# Altium schematic sheet noise_source.schdoc
size 400 x 277 mm; Device: default420x297; Symbol: default420x297; Name: default420x297; Size: "User"; Id: /; File: noise_source; Sheet: /
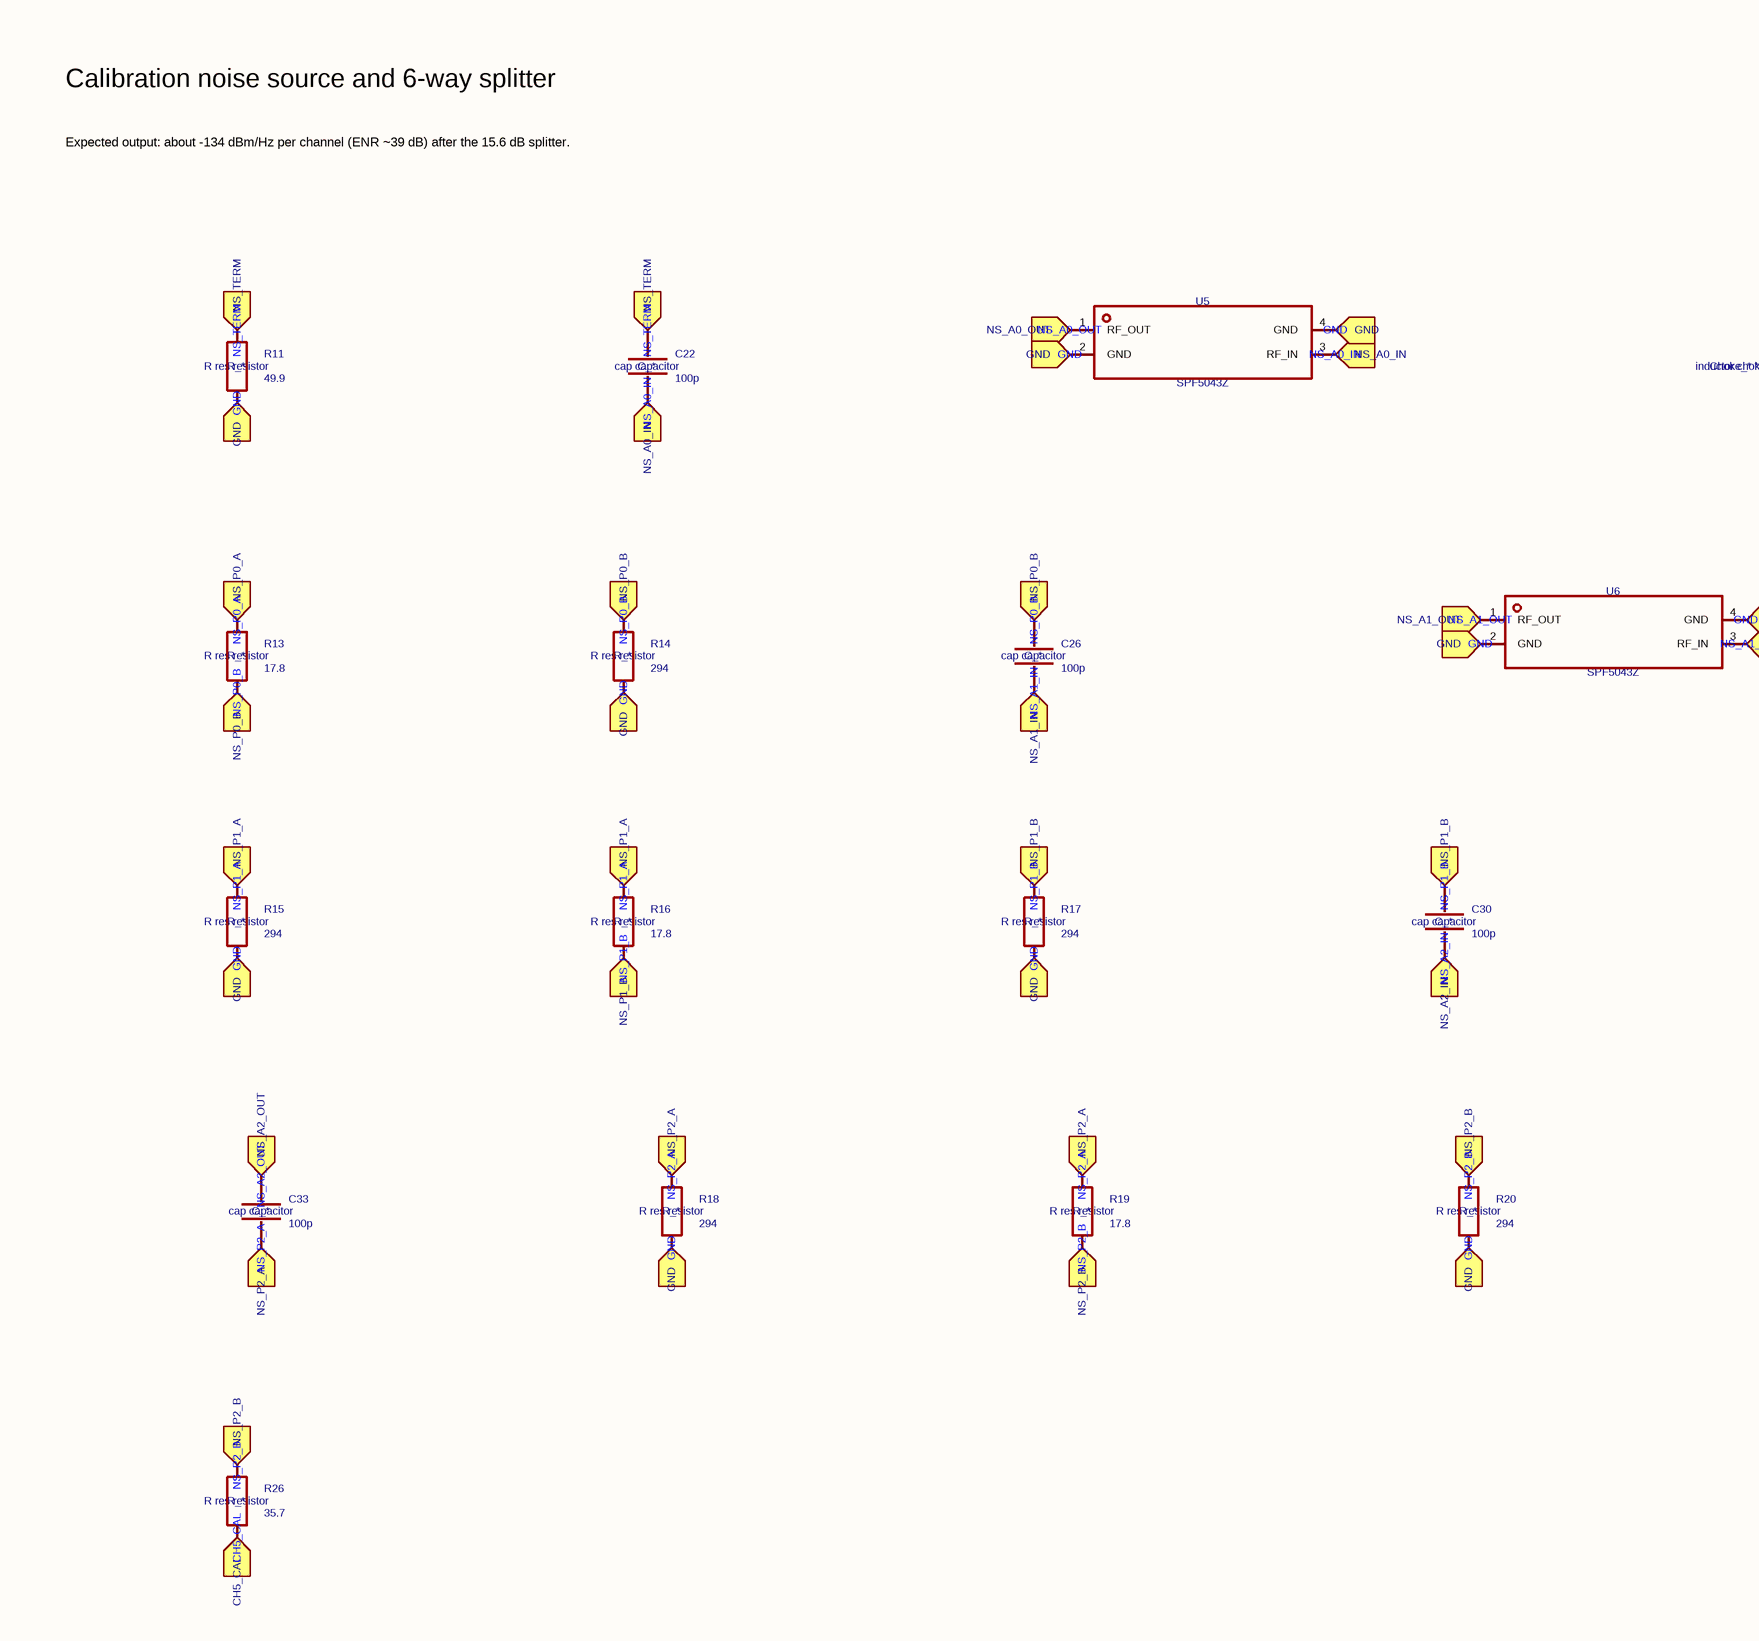
[diagram p0: noise_source.schdoc, left]
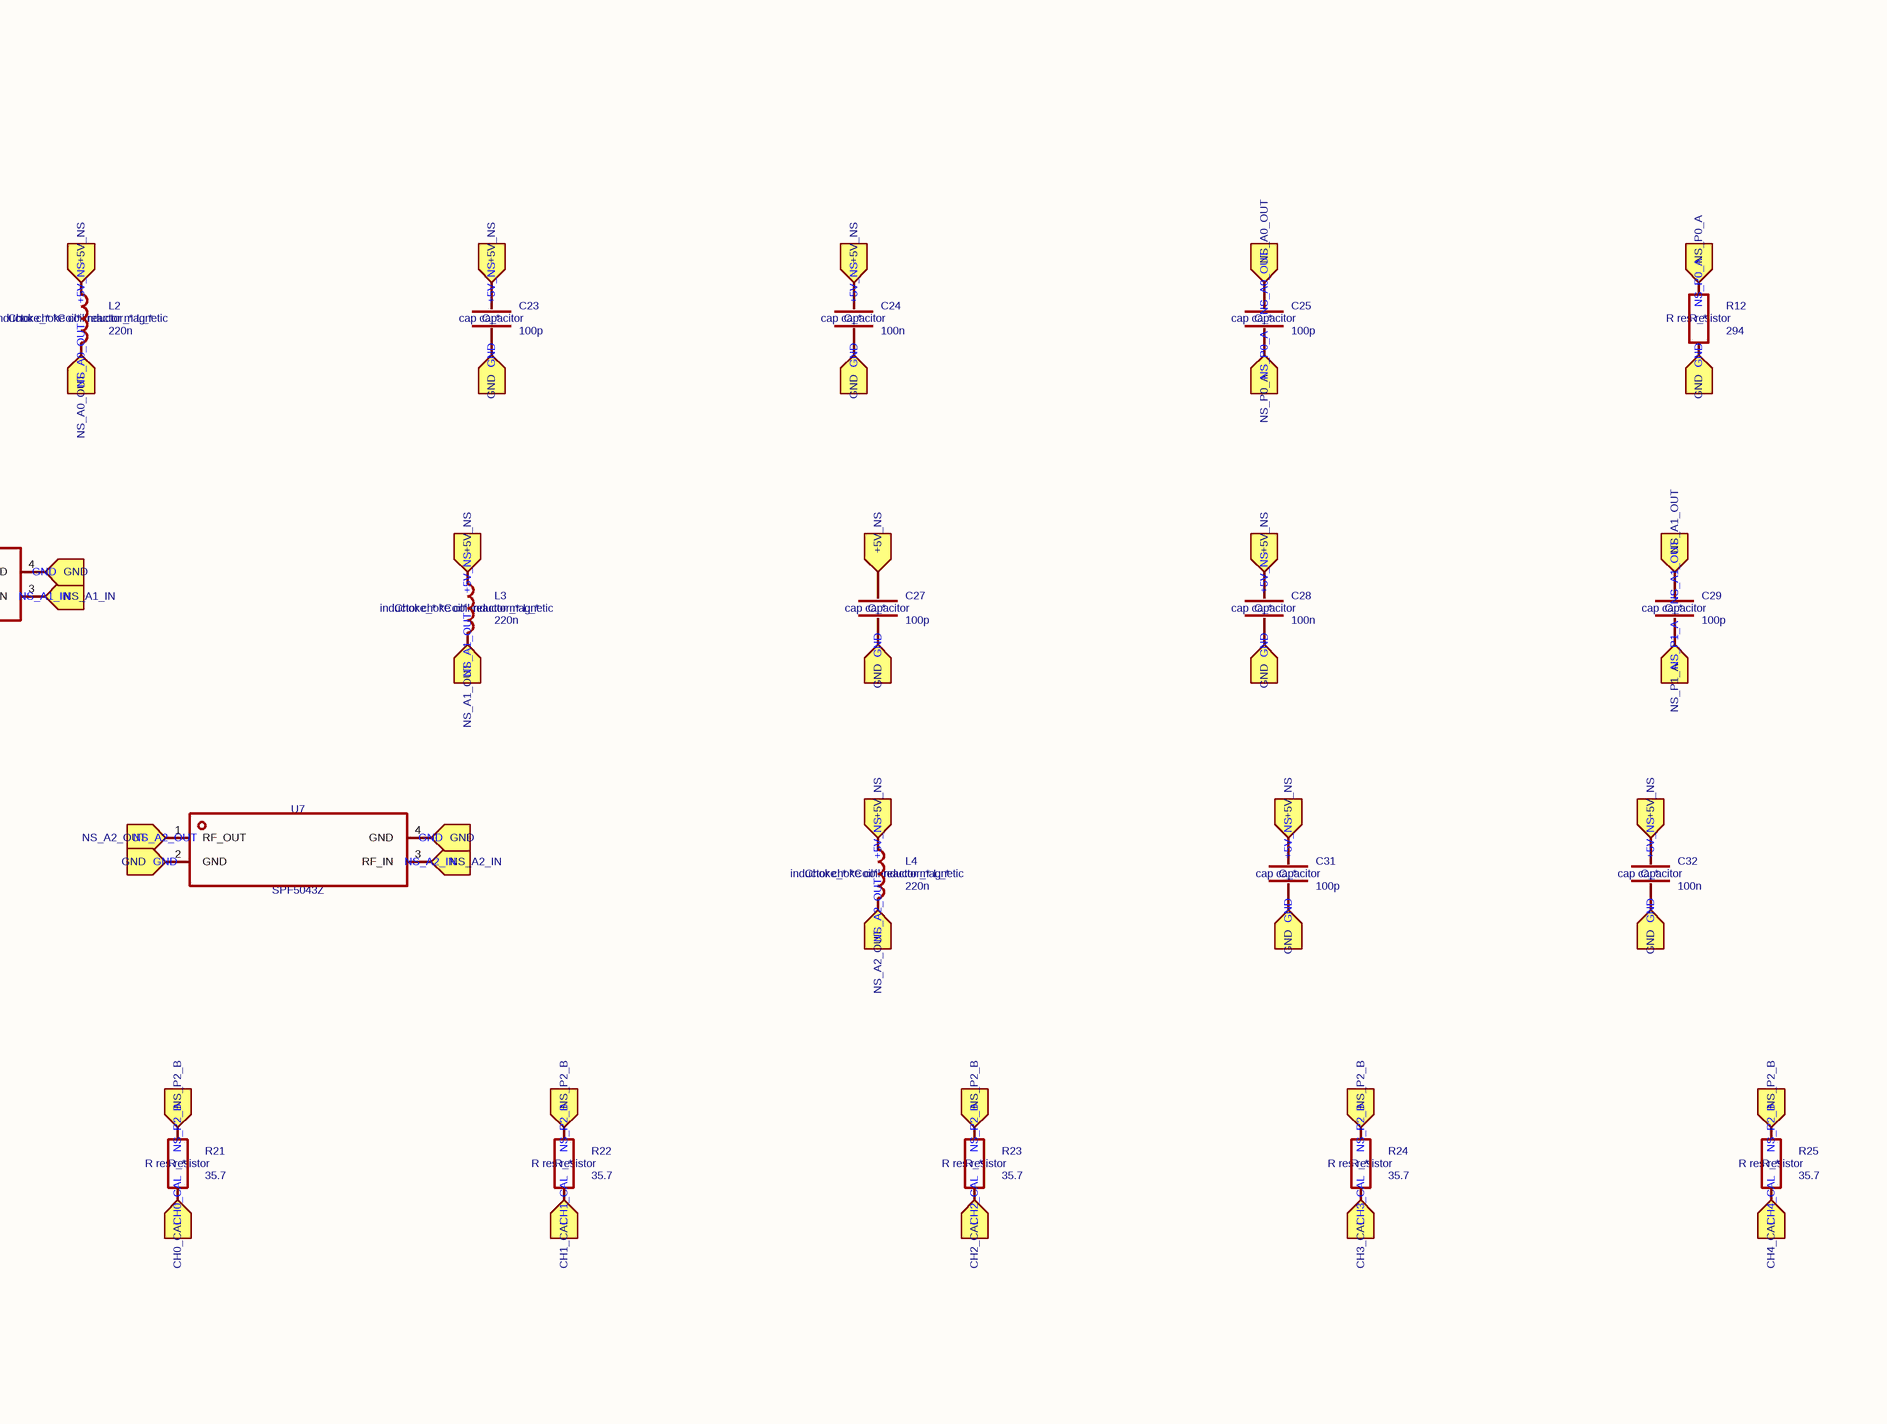
[diagram p1: noise_source.schdoc, right]

## Parts
C22  value 100p  ki_keywords: cap capacitor  ki_fp_filters: C_*  [Capacitor_SMD:C_0402_1005Metric]  (hidden comment: Device_C)
C23  value 100p  ki_keywords: cap capacitor  ki_fp_filters: C_*  [Capacitor_SMD:C_0402_1005Metric]  (hidden comment: Device_C)
C24  value 100n  ki_keywords: cap capacitor  ki_fp_filters: C_*  [Capacitor_SMD:C_0402_1005Metric]  (hidden comment: Device_C)
C25  value 100p  ki_keywords: cap capacitor  ki_fp_filters: C_*  [Capacitor_SMD:C_0402_1005Metric]  (hidden comment: Device_C)
C26  value 100p  ki_keywords: cap capacitor  ki_fp_filters: C_*  [Capacitor_SMD:C_0402_1005Metric]  (hidden comment: Device_C)
C27  value 100p  ki_keywords: cap capacitor  ki_fp_filters: C_*  [Capacitor_SMD:C_0402_1005Metric]  (hidden comment: Device_C)
C28  value 100n  ki_keywords: cap capacitor  ki_fp_filters: C_*  [Capacitor_SMD:C_0402_1005Metric]  (hidden comment: Device_C)
C29  value 100p  ki_keywords: cap capacitor  ki_fp_filters: C_*  [Capacitor_SMD:C_0402_1005Metric]  (hidden comment: Device_C)
C30  value 100p  ki_keywords: cap capacitor  ki_fp_filters: C_*  [Capacitor_SMD:C_0402_1005Metric]  (hidden comment: Device_C)
C31  value 100p  ki_keywords: cap capacitor  ki_fp_filters: C_*  [Capacitor_SMD:C_0402_1005Metric]  (hidden comment: Device_C)
C32  value 100n  ki_keywords: cap capacitor  ki_fp_filters: C_*  [Capacitor_SMD:C_0402_1005Metric]  (hidden comment: Device_C)
C33  value 100p  ki_keywords: cap capacitor  ki_fp_filters: C_*  [Capacitor_SMD:C_0402_1005Metric]  (hidden comment: Device_C)
L2  value 220n  ki_keywords: inductor choke coil reactor magnetic  ki_fp_filters: Choke_* *Coil* Inductor_* L_*  [Inductor_SMD:L_0603_1608Metric]  (hidden comment: Device_L)
L3  value 220n  ki_keywords: inductor choke coil reactor magnetic  ki_fp_filters: Choke_* *Coil* Inductor_* L_*  [Inductor_SMD:L_0603_1608Metric]  (hidden comment: Device_L)
L4  value 220n  ki_keywords: inductor choke coil reactor magnetic  ki_fp_filters: Choke_* *Coil* Inductor_* L_*  [Inductor_SMD:L_0603_1608Metric]  (hidden comment: Device_L)
R11  value 49.9  ki_keywords: R res resistor  ki_fp_filters: R_*  [Resistor_SMD:R_0402_1005Metric]  (hidden comment: Device_R)
R12  value 294  ki_keywords: R res resistor  ki_fp_filters: R_*  [Resistor_SMD:R_0402_1005Metric]  (hidden comment: Device_R)
R13  value 17.8  ki_keywords: R res resistor  ki_fp_filters: R_*  [Resistor_SMD:R_0402_1005Metric]  (hidden comment: Device_R)
R14  value 294  ki_keywords: R res resistor  ki_fp_filters: R_*  [Resistor_SMD:R_0402_1005Metric]  (hidden comment: Device_R)
R15  value 294  ki_keywords: R res resistor  ki_fp_filters: R_*  [Resistor_SMD:R_0402_1005Metric]  (hidden comment: Device_R)
R16  value 17.8  ki_keywords: R res resistor  ki_fp_filters: R_*  [Resistor_SMD:R_0402_1005Metric]  (hidden comment: Device_R)
R17  value 294  ki_keywords: R res resistor  ki_fp_filters: R_*  [Resistor_SMD:R_0402_1005Metric]  (hidden comment: Device_R)
R18  value 294  ki_keywords: R res resistor  ki_fp_filters: R_*  [Resistor_SMD:R_0402_1005Metric]  (hidden comment: Device_R)
R19  value 17.8  ki_keywords: R res resistor  ki_fp_filters: R_*  [Resistor_SMD:R_0402_1005Metric]  (hidden comment: Device_R)
R20  value 294  ki_keywords: R res resistor  ki_fp_filters: R_*  [Resistor_SMD:R_0402_1005Metric]  (hidden comment: Device_R)
R21  value 35.7  ki_keywords: R res resistor  ki_fp_filters: R_*  [Resistor_SMD:R_0402_1005Metric]  (hidden comment: Device_R)
R22  value 35.7  ki_keywords: R res resistor  ki_fp_filters: R_*  [Resistor_SMD:R_0402_1005Metric]  (hidden comment: Device_R)
R23  value 35.7  ki_keywords: R res resistor  ki_fp_filters: R_*  [Resistor_SMD:R_0402_1005Metric]  (hidden comment: Device_R)
R24  value 35.7  ki_keywords: R res resistor  ki_fp_filters: R_*  [Resistor_SMD:R_0402_1005Metric]  (hidden comment: Device_R)
R25  value 35.7  ki_keywords: R res resistor  ki_fp_filters: R_*  [Resistor_SMD:R_0402_1005Metric]  (hidden comment: Device_R)
R26  value 35.7  ki_keywords: R res resistor  ki_fp_filters: R_*  [Resistor_SMD:R_0402_1005Metric]  (hidden comment: Device_R)
U5  value SPF5043Z  [prc:SOT343_L2.0-W1.3-P1.30-LS2.1-BL]  (hidden comment: prc_SPF5043Z)
U6  value SPF5043Z  [prc:SOT343_L2.0-W1.3-P1.30-LS2.1-BL]  (hidden comment: prc_SPF5043Z)
U7  value SPF5043Z  [prc:SOT343_L2.0-W1.3-P1.30-LS2.1-BL]  (hidden comment: prc_SPF5043Z)

## Ports
+5V_NS (in), CH0_CAL (in), CH1_CAL (in), CH2_CAL (in), CH3_CAL (in), CH4_CAL (in), CH5_CAL (in), GND (in), NS_A0_IN (in), NS_A0_OUT (in), NS_A1_IN (in), NS_A1_OUT (in), NS_A2_IN (in), NS_A2_OUT (in), NS_P0_A (in), NS_P0_B (in), NS_P1_A (in), NS_P1_B (in), NS_P2_A (in), NS_P2_B (in), NS_TERM (in)

## Nets
+5V_NS: C23.1 C24.1 C27.1 C28.1 C31.1 C32.1 L2.1 L3.1 L4.1 ; port +5V_NS
CH0_CAL: R21.2 ; port CH0_CAL
CH1_CAL: R22.2 ; port CH1_CAL
CH2_CAL: R23.2 ; port CH2_CAL
CH3_CAL: R24.2 ; port CH3_CAL
CH4_CAL: R25.2 ; port CH4_CAL
CH5_CAL: R26.2 ; port CH5_CAL
GND: C23.2 C24.2 C27.2 C28.2 C31.2 C32.2 R11.2 R12.2 R14.2 R15.2 R17.2 R18.2 R20.2 U5.2(GND) U5.4(GND) U6.2(GND) U6.4(GND) U7.2(GND) U7.4(GND) ; port GND
NS_A0_IN: C22.2 U5.3(RF_IN) ; port NS_A0_IN
NS_A0_OUT: C25.1 L2.2 U5.1(RF_OUT) ; port NS_A0_OUT
NS_A1_IN: C26.2 U6.3(RF_IN) ; port NS_A1_IN
NS_A1_OUT: C29.1 L3.2 U6.1(RF_OUT) ; port NS_A1_OUT
NS_A2_IN: C30.2 U7.3(RF_IN) ; port NS_A2_IN
NS_A2_OUT: C33.1 L4.2 U7.1(RF_OUT) ; port NS_A2_OUT
NS_P0_A: C25.2 R12.1 R13.1 ; port NS_P0_A
NS_P0_B: C26.1 R13.2 R14.1 ; port NS_P0_B
NS_P1_A: C29.2 R15.1 R16.1 ; port NS_P1_A
NS_P1_B: C30.1 R16.2 R17.1 ; port NS_P1_B
NS_P2_A: C33.2 R18.1 R19.1 ; port NS_P2_A
NS_P2_B: R19.2 R20.1 R21.1 R22.1 R23.1 R24.1 R25.1 R26.1 ; port NS_P2_B
NS_TERM: C22.1 R11.1 ; port NS_TERM

## Notes on the sheet
- Calibration noise source and 6-way splitter
- Expected output: about -134 dBm/Hz per channel (ENR ~39 dB) after the 15.6 dB splitter.
- 1
- 2
- 3
- 4
- 5
- 6
- 7
- 8
- A
- B
- C
- D
- E
- Size:"User"
- Title:
- File:noise_source
- Sheet:/
- Date:
- Rev:
- F
- Id:/

## Library data of the parts
C22 = Device_C: UniqueId: 7f35450ac3171d20; KiLib_Generator: SMD_2terminal_chip_molded; AddInBom: yes; Device: Device_C; Symbol: Device_C; FootprintName: Capacitor_SMD:C_0402_1005Metric
C23 = Device_C: UniqueId: 8bc5c1e1749a19fa; KiLib_Generator: SMD_2terminal_chip_molded; AddInBom: yes; Device: Device_C; Symbol: Device_C; FootprintName: Capacitor_SMD:C_0402_1005Metric
C24 = Device_C: UniqueId: 7c674fedd66d7165; KiLib_Generator: SMD_2terminal_chip_molded; AddInBom: yes; Device: Device_C; Symbol: Device_C; LCSC: C1525; FootprintName: Capacitor_SMD:C_0402_1005Metric
C25 = Device_C: UniqueId: d99985aa138ce050; KiLib_Generator: SMD_2terminal_chip_molded; AddInBom: yes; Device: Device_C; Symbol: Device_C; FootprintName: Capacitor_SMD:C_0402_1005Metric
C26 = Device_C: UniqueId: 5bc8fc857418e778; KiLib_Generator: SMD_2terminal_chip_molded; AddInBom: yes; Device: Device_C; Symbol: Device_C; FootprintName: Capacitor_SMD:C_0402_1005Metric
C27 = Device_C: UniqueId: a26eb100929f0697; KiLib_Generator: SMD_2terminal_chip_molded; AddInBom: yes; Device: Device_C; Symbol: Device_C; FootprintName: Capacitor_SMD:C_0402_1005Metric
C28 = Device_C: UniqueId: e3aeb17489c0ab5d; KiLib_Generator: SMD_2terminal_chip_molded; AddInBom: yes; Device: Device_C; Symbol: Device_C; LCSC: C1525; FootprintName: Capacitor_SMD:C_0402_1005Metric
C29 = Device_C: UniqueId: 5bfcee5f0e3d202c; KiLib_Generator: SMD_2terminal_chip_molded; AddInBom: yes; Device: Device_C; Symbol: Device_C; FootprintName: Capacitor_SMD:C_0402_1005Metric
C30 = Device_C: UniqueId: a2ee6ceb65d30336; KiLib_Generator: SMD_2terminal_chip_molded; AddInBom: yes; Device: Device_C; Symbol: Device_C; FootprintName: Capacitor_SMD:C_0402_1005Metric
C31 = Device_C: UniqueId: cc1d00c51cc12124; KiLib_Generator: SMD_2terminal_chip_molded; AddInBom: yes; Device: Device_C; Symbol: Device_C; FootprintName: Capacitor_SMD:C_0402_1005Metric
C32 = Device_C: UniqueId: d2625f4b4bd439ef; KiLib_Generator: SMD_2terminal_chip_molded; AddInBom: yes; Device: Device_C; Symbol: Device_C; LCSC: C1525; FootprintName: Capacitor_SMD:C_0402_1005Metric
C33 = Device_C: UniqueId: deb55bbe20a101cf; KiLib_Generator: SMD_2terminal_chip_molded; AddInBom: yes; Device: Device_C; Symbol: Device_C; FootprintName: Capacitor_SMD:C_0402_1005Metric
L2 = Device_L: UniqueId: 3f6ee2b1a34b017f; KiLib_Generator: SMD_2terminal_chip_molded; AddInBom: yes; Device: Device_L; Symbol: Device_L; FootprintName: Inductor_SMD:L_0603_1608Metric
L3 = Device_L: UniqueId: 510f7e7047da8839; KiLib_Generator: SMD_2terminal_chip_molded; AddInBom: yes; Device: Device_L; Symbol: Device_L; FootprintName: Inductor_SMD:L_0603_1608Metric
L4 = Device_L: UniqueId: fd5a5c0f77d1aabb; KiLib_Generator: SMD_2terminal_chip_molded; AddInBom: yes; Device: Device_L; Symbol: Device_L; FootprintName: Inductor_SMD:L_0603_1608Metric
R11 = Device_R: UniqueId: 763cf8d5648cb4fd; KiLib_Generator: SMD_2terminal_chip_molded; AddInBom: yes; Device: Device_R; Symbol: Device_R; FootprintName: Resistor_SMD:R_0402_1005Metric
R12 = Device_R: UniqueId: 15ac9218146e0f4b; KiLib_Generator: SMD_2terminal_chip_molded; AddInBom: yes; Device: Device_R; Symbol: Device_R; FootprintName: Resistor_SMD:R_0402_1005Metric
R13 = Device_R: UniqueId: ff4077a9ca69db92; KiLib_Generator: SMD_2terminal_chip_molded; AddInBom: yes; Device: Device_R; Symbol: Device_R; FootprintName: Resistor_SMD:R_0402_1005Metric
R14 = Device_R: UniqueId: 8b54177fc4d64d35; KiLib_Generator: SMD_2terminal_chip_molded; AddInBom: yes; Device: Device_R; Symbol: Device_R; FootprintName: Resistor_SMD:R_0402_1005Metric
R15 = Device_R: UniqueId: feece054417b9159; KiLib_Generator: SMD_2terminal_chip_molded; AddInBom: yes; Device: Device_R; Symbol: Device_R; FootprintName: Resistor_SMD:R_0402_1005Metric
R16 = Device_R: UniqueId: 3c543c7c58e1cc80; KiLib_Generator: SMD_2terminal_chip_molded; AddInBom: yes; Device: Device_R; Symbol: Device_R; FootprintName: Resistor_SMD:R_0402_1005Metric
R17 = Device_R: UniqueId: 6346d187b4e0bc9c; KiLib_Generator: SMD_2terminal_chip_molded; AddInBom: yes; Device: Device_R; Symbol: Device_R; FootprintName: Resistor_SMD:R_0402_1005Metric
R18 = Device_R: UniqueId: 5f673669f0d56d8f; KiLib_Generator: SMD_2terminal_chip_molded; AddInBom: yes; Device: Device_R; Symbol: Device_R; FootprintName: Resistor_SMD:R_0402_1005Metric
R19 = Device_R: UniqueId: a32210a39874d8f8; KiLib_Generator: SMD_2terminal_chip_molded; AddInBom: yes; Device: Device_R; Symbol: Device_R; FootprintName: Resistor_SMD:R_0402_1005Metric
R20 = Device_R: UniqueId: 13e77c54ede4b306; KiLib_Generator: SMD_2terminal_chip_molded; AddInBom: yes; Device: Device_R; Symbol: Device_R; FootprintName: Resistor_SMD:R_0402_1005Metric
R21 = Device_R: UniqueId: c77b08197b178948; KiLib_Generator: SMD_2terminal_chip_molded; AddInBom: yes; Device: Device_R; Symbol: Device_R; FootprintName: Resistor_SMD:R_0402_1005Metric
R22 = Device_R: UniqueId: fa394caafc8878d8; KiLib_Generator: SMD_2terminal_chip_molded; AddInBom: yes; Device: Device_R; Symbol: Device_R; FootprintName: Resistor_SMD:R_0402_1005Metric
R23 = Device_R: UniqueId: d92c635076b33213; KiLib_Generator: SMD_2terminal_chip_molded; AddInBom: yes; Device: Device_R; Symbol: Device_R; FootprintName: Resistor_SMD:R_0402_1005Metric
R24 = Device_R: UniqueId: f7952e9f9cd6773b; KiLib_Generator: SMD_2terminal_chip_molded; AddInBom: yes; Device: Device_R; Symbol: Device_R; FootprintName: Resistor_SMD:R_0402_1005Metric
R25 = Device_R: UniqueId: 6f4c4beafd605d3e; KiLib_Generator: SMD_2terminal_chip_molded; AddInBom: yes; Device: Device_R; Symbol: Device_R; FootprintName: Resistor_SMD:R_0402_1005Metric
R26 = Device_R: UniqueId: 09b823a69019dbbf; KiLib_Generator: SMD_2terminal_chip_molded; AddInBom: yes; Device: Device_R; Symbol: Device_R; FootprintName: Resistor_SMD:R_0402_1005Metric
U5 = prc_SPF5043Z: Manufacturer: Qorvo; ki_keywords: RF Amplifiers; UniqueId: adf583383e4d69d4; AddInBom: yes; Device: prc_SPF5043Z; Symbol: prc_SPF5043Z; UserDocLink: https://lcsc.com/product-detail/RF-Amplifiers_Qorvo-SPF5043Z_C470902.html; LCSC: C470902; MPN: SPF5043Z; LCSC Part: C470902; FootprintName: prc:SOT343_L2.0-W1.3-P1.30-LS2.1-BL
U6 = prc_SPF5043Z: Manufacturer: Qorvo; ki_keywords: RF Amplifiers; UniqueId: 124c013cfc851acc; AddInBom: yes; Device: prc_SPF5043Z; Symbol: prc_SPF5043Z; UserDocLink: https://lcsc.com/product-detail/RF-Amplifiers_Qorvo-SPF5043Z_C470902.html; LCSC: C470902; MPN: SPF5043Z; LCSC Part: C470902; FootprintName: prc:SOT343_L2.0-W1.3-P1.30-LS2.1-BL
U7 = prc_SPF5043Z: Manufacturer: Qorvo; ki_keywords: RF Amplifiers; UniqueId: 4ec783ed4741de1f; AddInBom: yes; Device: prc_SPF5043Z; Symbol: prc_SPF5043Z; UserDocLink: https://lcsc.com/product-detail/RF-Amplifiers_Qorvo-SPF5043Z_C470902.html; LCSC: C470902; MPN: SPF5043Z; LCSC Part: C470902; FootprintName: prc:SOT343_L2.0-W1.3-P1.30-LS2.1-BL